# Altium project Custom_Keyboard.PrjPcb (part 4 of 4)

## Sheet BufferIC_Section.SchDoc
size A4
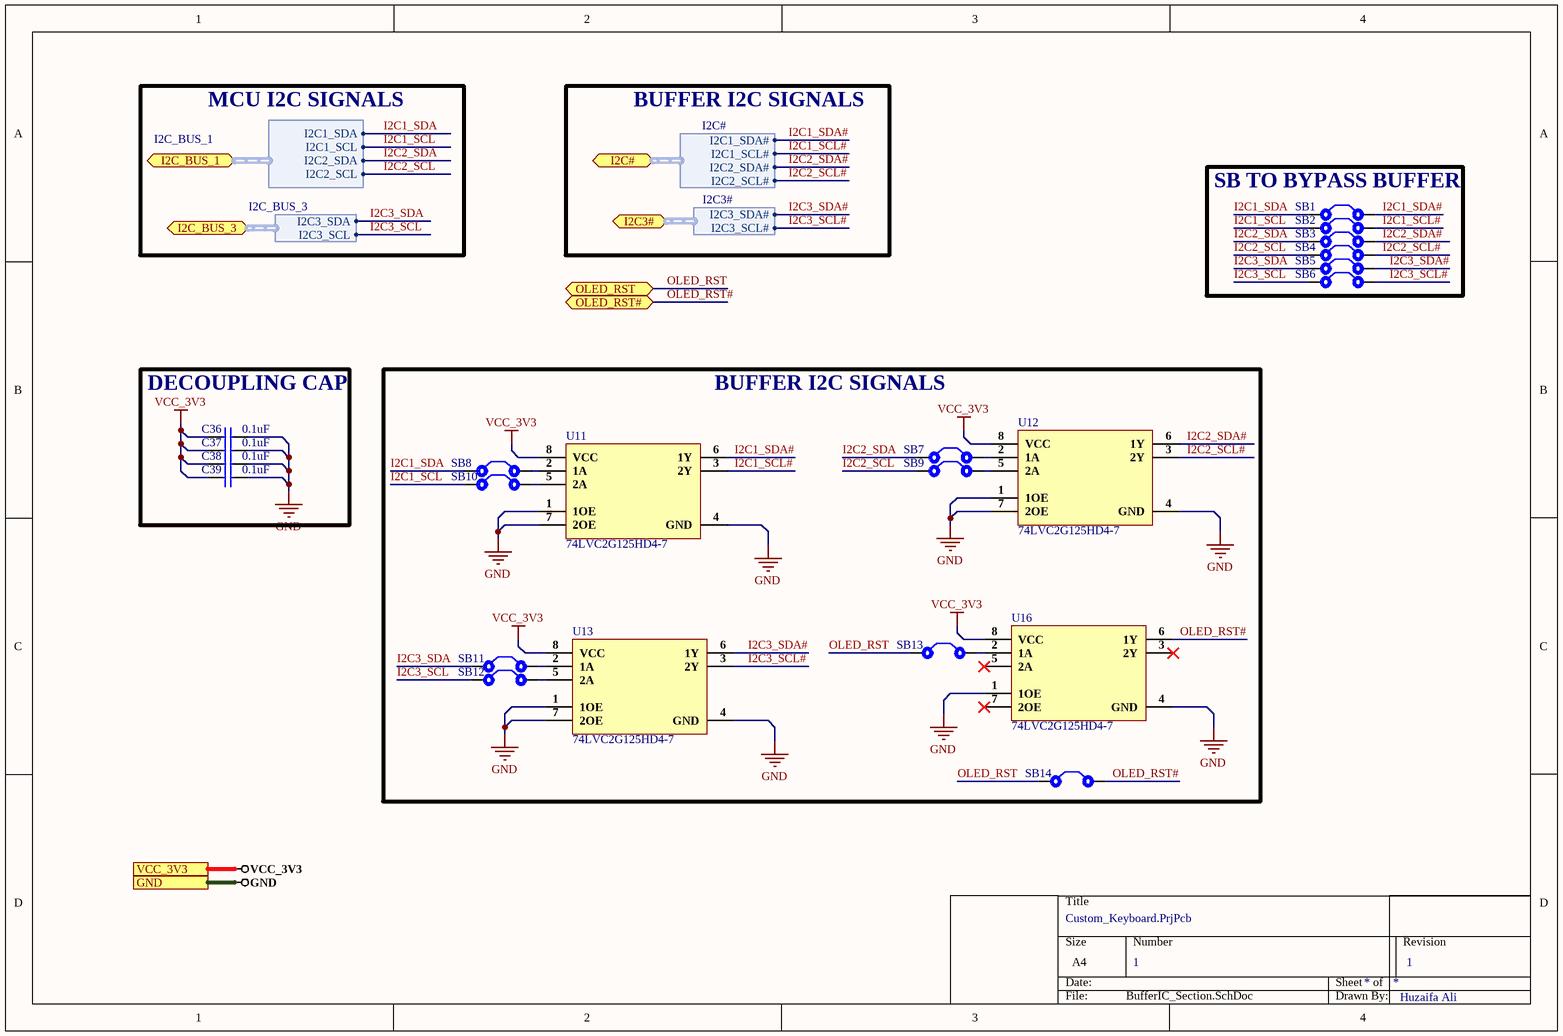
[diagram p14: BufferIC_Section.SchDoc]

### Parts
C36  0.1uF  [Cap0603]
C37  0.1uF  [Cap0603]
C38  0.1uF  [Cap0603]
C39  0.1uF  [Cap0603]
SB1  Solder Bridge  [Solder Bridge]  (value not drawn)
SB2  Solder Bridge  [Solder Bridge]  (value not drawn)
SB3  Solder Bridge  [Solder Bridge]  (value not drawn)
SB4  Solder Bridge  [Solder Bridge]  (value not drawn)
SB5  Solder Bridge  [Solder Bridge]  (value not drawn)
SB6  Solder Bridge  [Solder Bridge]  (value not drawn)
SB7  Solder Bridge  [Solder Bridge]  (value not drawn)
SB8  Solder Bridge  [Solder Bridge]  (value not drawn)
SB9  Solder Bridge  [Solder Bridge]  (value not drawn)
SB10  Solder Bridge  [Solder Bridge]  (value not drawn)
SB11  Solder Bridge  [Solder Bridge]  (value not drawn)
SB12  Solder Bridge  [Solder Bridge]  (value not drawn)
SB13  Solder Bridge  [Solder Bridge]  (value not drawn)
SB14  Solder Bridge  [Solder Bridge]  (value not drawn)
U11  74LVC2G125HD4-7  [74LVC2G125HD4-7]
U12  74LVC2G125HD4-7  [74LVC2G125HD4-7]
U13  74LVC2G125HD4-7  [74LVC2G125HD4-7]
U16  74LVC2G125HD4-7  [74LVC2G125HD4-7]

### Blocks framed on the sheet
SB TO BYPASS BUFFER: SB1-SB6
DECOUPLING CAP: C36-C39
BUFFER I2C SIGNALS: SB7-SB14 U11-U13 U16

### Ports
GND, I2C3# (bidir, harness I2C3#), I2C# (bidir, harness I2C#), I2C_BUS_1 (bidir, harness I2C_BUS_1), I2C_BUS_3 (bidir, harness I2C_BUS_3), OLED_RST (bidir), OLED_RST# (bidir), VCC_3V3

### Harnesses
I2C_BUS_1: I2C2_SDA, I2C1_SCL, I2C1_SDA, I2C2_SCL
I2C_BUS_3: I2C3_SDA, I2C3_SCL
I2C#: I2C1_SDA#, I2C1_SCL#, I2C2_SDA#, I2C2_SCL#
I2C3#: I2C3_SDA#, I2C3_SCL#

### Nets
GND: C36.2 C37.2 C38.2 C39.2 U11.1(1OE) U11.4(GND) U11.7(2OE) U12.1(1OE) U12.4(GND) U12.7(2OE) U13.1(1OE) U13.4(GND) U13.7(2OE) U16.1(1OE) U16.4(GND) ; port GND
VCC_3V3: C36.1 C37.1 C38.1 C39.1 U11.8(VCC) U12.8(VCC) U13.8(VCC) U16.8(VCC) ; port VCC_3V3
I2C1_SCL: SB2.1 SB10.1 ; port I2C_BUS_1.I2C1_SCL
I2C1_SCL#: SB2.2 U11.3(2Y) ; port I2C#.I2C1_SCL#  [project net I2C#.I2C1_SCL#]
I2C1_SDA: SB1.1 SB8.1 ; port I2C_BUS_1.I2C1_SDA
I2C1_SDA#: SB1.2 U11.6(1Y) ; port I2C#.I2C1_SDA#  [project net I2C#.I2C1_SDA#]
I2C2_SCL: SB4.1 SB9.1 ; port I2C_BUS_1.I2C2_SCL
I2C2_SCL#: SB4.2 U12.3(2Y) ; port I2C#.I2C2_SCL#  [project net I2C#.I2C2_SCL#]
I2C2_SDA: SB3.1 SB7.1 ; port I2C_BUS_1.I2C2_SDA
I2C2_SDA#: SB3.2 U12.6(1Y) ; port I2C#.I2C2_SDA#  [project net I2C#.I2C2_SDA#]
I2C3_SCL: SB6.1 SB12.1 ; port I2C_BUS_3.I2C3_SCL
I2C3_SCL#: SB6.2 U13.3(2Y) ; port I2C3#.I2C3_SCL#  [project net I2C3#.I2C3_SCL#]
I2C3_SDA: SB5.1 SB11.1 ; port I2C_BUS_3.I2C3_SDA
I2C3_SDA#: SB5.2 U13.6(1Y) ; port I2C3#.I2C3_SDA#  [project net I2C3#.I2C3_SDA#]
OLED_RST: SB13.1 SB14.1 ; port OLED_RST
OLED_RST#: SB14.2 U16.6(1Y) ; port OLED_RST#
NetSB7_2: SB7.2 U12.2(1A)
NetSB8_2: SB8.2 U11.2(1A)
NetSB9_2: SB9.2 U12.5(2A)
NetSB10_2: SB10.2 U11.5(2A)
NetSB11_2: SB11.2 U13.2(1A)
NetSB12_2: SB12.2 U13.5(2A)
NetSB13_2: SB13.2 U16.2(1A)

Not connected (* = marked no-connect by the designer): U16 3(2Y)* 5(2A)* 7(2OE)*

### Notes on the sheet
- MCU I2C SIGNALS
- BUFFER I2C SIGNALS
- 1
- Huzaifa Ali

### Library data of the parts
C36-C39 = CC0603ZRY5V9BB104: CAP CER 0.1UF 50V Y5V 0603; Manufacturer: Yageo; Capacitance: 100nF; Tolerance: 80%; Supplier 1: Digi-Key; Manufacturer Part Number: CC0603ZRY5V9BB104; Stock 1: 15000880; Pricing 1: 1=0.1, 10=0.075, 100=0.0334, 500=0.02386, 1000=0.01874 (USD); Mount: Surface Mount; Case/Package: 0603; Number of Pins: 2; Case Code (Metric): 1608; Case Code (Imperial): 0603; Min Operating Temperature: -30°C; Max Operating Temperature: 85°C; Dielectric: Y5V; Voltage Rating: 50V; Package Quantity: 1; Packaging: Tape and Reel; Voltage Rating (DC): 50V; Termination: SMD/SMT; Composition: Ceramic; Voltage: 50V; Length: 1.6mm; Height: 0.8mm; Width: 0.031inch; Thickness: 0.035inch; Depth: 0.8mm; Radiation Hardening: No; REACH SVHC: No SVHC; Lead Free: Lead Free; Halogen Free: Halogen Free; ComponentLink1URL: http://www.yageo.com/documents/recent/UPY-GPHC_Y5V_6.3V-to-50V_8.pdf?src-supplier=Digi-Key; ComponentLink1Description: http://www.yageo.com/documents/recent/UPY-GPHC_Y5V_6.3V-to-50V_8.pdf?src-supplier=Digi-Key; ComponentLink2URL: http://www.yageo.com/documents/recent/UPY-GPHC_Y5V_6.3V-to-50V_5.pdf?src-supplier=Avnet+Europe; ComponentLink2Description: http://www.yageo.com/documents/recent/UPY-GPHC_Y5V_6.3V-to-50V_5.pdf?src-supplier=Avnet+Europe; ComponentLink3URL: https://www.verical.com/server-webapp/html/getDatasheet?partID=403611&src-supplier=Verical; ComponentLink3Description: https://www.verical.com/server-webapp/html/getDatasheet?partID=403611&src-supplier=Verical; ComponentLink4URL: http://www.mouser.com/ds/2/447/Yageo_UPY-GP_NP0_16V-to-50V_9-358835.pdf?src-supplier=Mouser; ComponentLink4Description: http://www.mouser.com/ds/2/447/Yageo_UPY-GP_NP0_16V-to-50V_9-358835.pdf?src-supplier=Mouser; ComponentLink5URL: http://www.farnell.com/datasheets/1132289.pdf?src-supplier=Element14; ComponentLink5Description: http://www.farnell.com/datasheets/1132289.pdf?src-supplier=Element14; Supplier Part Number 1: 311-1343-1-ND
SB1-SB14 = Solder Bridge: Solder Bridge ON
U11-U13 U16 = 74LVC2G125HD4-7: IC BUFFER NON-INVERT 5.5V 8DFN; Manufacturer: Diodes; Logic Function: Buffer,Inverting; Number of Elements: 2; Number of Bits per Element: 1; High Level Output Current: 32mA; Supplier 1: Digi-Key; Manufacturer Part Number: 74LVC2G125HD4-7; RoHS: Yes; Category: Logic Gates; Pricing 1: 1=0.47000, 10=0.35300, 25=0.30880, 100=0.19980, 250=0.16536, 500=0.13228, 1000=0.10142, 2500=0.08819 (USD); Mount: Surface Mount; Number of Pins: 8; Min Operating Temperature: -40°C; Max Operating Temperature: 125°C; Packaging: Tape and Reel; Low Level Output Current: 32mA; RoHS Compliant: Yes; ComponentLink1URL: https://www.diodes.com/assets/Datasheets/74LVC2G125.pdf?src-supplier=Digi-Key; ComponentLink1Description: https://www.diodes.com/assets/Datasheets/74LVC2G125.pdf?src-supplier=Digi-Key; Supplier Part Number 1: 74LVC2G125HD4-7DIDKR-ND

## Nets that join several sheets
GND: Controller_Section_1 (29 pins), Power_Section (14 pins), Connector_Sheet (6 pins), Connector_Sheet_2 (J3.MP1 J3.MP2), Mux_Sheet_1 (14 pins), Mux_Sheet_2 (11 pins), Mux_Sheet _3 (7 pins), BufferIC_Section (15 pins)
VCC_3V3: Controller_Section_1 (22 pins), Controller_Section_2 (16 pins), Power_Section (C32.1 C33.1 U1.1), Connector_Sheet (J2.25), Mux_Sheet_1 (22 pins), Mux_Sheet_2 (15 pins), RPull_Section (80 pins), Rpull_Section2 (64 pins), Mux_Sheet _3 (9 pins), BufferIC_Section (8 pins)
VCC_5V: Power_Section (10 pins), Connector_Sheet (P1.1)
VDD: Power_Section (Q1.3), Connector_Sheet (J2.24)
COl_1: Controller_Section_2 (R6.1 U2.81), Connector_Sheet (J2.1)
COl_2: Controller_Section_2 (R37.1 U2.82), Connector_Sheet (J2.2)
COl_3: Controller_Section_2 (R38.1 U2.83), Connector_Sheet (J2.3)
COl_4: Controller_Section_2 (R39.1 U2.84), Connector_Sheet (J2.4)
COl_5: Controller_Section_2 (R40.1 U2.85), Connector_Sheet (J2.5)
COl_6: Controller_Section_2 (R41.1 U2.25), Connector_Sheet (J2.6)
COl_7: Controller_Section_2 (R42.1 U2.87), Connector_Sheet (J2.7)
COl_8: Controller_Section_2 (R110.1 U2.24), Connector_Sheet (J2.8)
COl_9: Controller_Section_2 (R111.1 U2.16), Connector_Sheet (J2.9)
COl_10: Controller_Section_2 (R112.1 U2.17), Connector_Sheet (J2.10)
COl_11: Controller_Section_2 (R113.1 U2.18), Connector_Sheet (J2.11)
COl_12: Controller_Section_2 (R114.1 U2.33), Connector_Sheet (J2.12)
COl_13: Controller_Section_2 (R115.1 U2.34), Connector_Sheet (J2.13)
COl_14: Controller_Section_2 (R116.1 U2.63), Connector_Sheet (J2.14)
COl_15: Controller_Section_2 (R117.1 U2.64), Connector_Sheet (J2.15)
COl_16: Controller_Section_2 (R118.1 U2.65), Connector_Sheet (J2.16)
DM: Controller_Section_2 (U2.70), Connector_Sheet (P2.1)
DP: Controller_Section_2 (U2.71), Connector_Sheet (P3.1)
I2C1_SCL: Controller_Section_2 (U2.92), BufferIC_Section (SB2.1 SB10.1)
I2C1_SDA: Controller_Section_2 (U2.93), BufferIC_Section (SB1.1 SB8.1)
I2C2_SCL: Controller_Section_2 (U2.47), BufferIC_Section (SB4.1 SB9.1)
I2C2_SDA: Controller_Section_2 (U2.48), BufferIC_Section (SB3.1 SB7.1)
I2C3#.I2C3_SCL#: Mux_Sheet_2 (R27.2 U6.22 U7.22 U10.22), BufferIC_Section (SB6.2 U13.3)
I2C3#.I2C3_SDA#: Mux_Sheet_2 (R25.2 U6.23 U7.23 U10.23), BufferIC_Section (SB5.2 U13.6)
I2C3_SCL: Controller_Section_2 (U2.67), BufferIC_Section (SB6.1 SB12.1)
I2C3_SDA: Controller_Section_2 (U2.66), BufferIC_Section (SB5.1 SB11.1)
I2C#.I2C1_SCL#: Mux_Sheet_1 (R11.2 U3.22 U4.22), Mux_Sheet _3 (U15.22), BufferIC_Section (SB2.2 U11.3)
I2C#.I2C1_SDA#: Mux_Sheet_1 (R9.2 U3.23 U4.23), Mux_Sheet _3 (U15.23), BufferIC_Section (SB1.2 U11.6)
I2C#.I2C2_SCL#: Mux_Sheet_1 (R20.2 U5.22 U9.22), Mux_Sheet _3 (U14.22), BufferIC_Section (SB4.2 U12.3)
I2C#.I2C2_SDA#: Mux_Sheet_1 (R19.2 U5.23 U9.23), Mux_Sheet _3 (U14.23), BufferIC_Section (SB3.2 U12.6)
MRST##.MRST8: Controller_Section_2 (U2.78), Mux_Sheet _3 (R142.2 U15.3)
MRST##.MRST9: Controller_Section_2 (U2.79), Mux_Sheet _3 (R140.2 U14.3)
MRST#.MRST4: Controller_Section_2 (U2.59), Mux_Sheet_2 (R32.2 U6.3)
MRST#.MRST5: Controller_Section_2 (U2.60), Mux_Sheet_2 (R34.2 U7.3)
MRST#.MRST7: Controller_Section_2 (U2.61), Mux_Sheet_2 (R135.2 U10.3)
MRST.MRST1: Controller_Section_2 (U2.55), Mux_Sheet_1 (R17.2 U4.3)
MRST.MRST2: Controller_Section_2 (U2.56), Mux_Sheet_1 (R13.2 U3.3)
MRST.MRST3: Controller_Section_2 (U2.57), Mux_Sheet_1 (R23.2 U5.3)
MRST.MRST6: Controller_Section_2 (U2.58), Mux_Sheet_1 (R26.2 U9.3)
MUX_1.SCL_1: Connector_Sheet (J1.9), Mux_Sheet_1 (U4.5), RPull_Section (R44.1)
MUX_1.SCL_2: Connector_Sheet (J1.10), Mux_Sheet_1 (U4.7), RPull_Section (R46.1)
MUX_1.SCL_3: Connector_Sheet (J1.11), Mux_Sheet_1 (U4.9), RPull_Section (R48.1)
MUX_1.SCL_4: Connector_Sheet (J1.12), Mux_Sheet_1 (U4.11), RPull_Section (R50.1)
MUX_1.SCL_5: Connector_Sheet (J1.13), Mux_Sheet_1 (U4.14), RPull_Section (R52.1)
MUX_1.SCL_6: Connector_Sheet (J1.14), Mux_Sheet_1 (U4.16), RPull_Section (R54.1)
MUX_1.SCL_7: Connector_Sheet (J1.15), Mux_Sheet_1 (U4.18), RPull_Section (R56.1)
MUX_1.SCL_8: Connector_Sheet (J1.16), Mux_Sheet_1 (U4.20), RPull_Section (R58.1)
MUX_1.SDA_1: Connector_Sheet (J1.1), Mux_Sheet_1 (U4.4), RPull_Section (R43.1)
MUX_1.SDA_2: Connector_Sheet (J1.2), Mux_Sheet_1 (U4.6), RPull_Section (R45.1)
MUX_1.SDA_3: Connector_Sheet (J1.3), Mux_Sheet_1 (U4.8), RPull_Section (R47.1)
MUX_1.SDA_4: Connector_Sheet (J1.4), Mux_Sheet_1 (U4.10), RPull_Section (R49.1)
MUX_1.SDA_5: Connector_Sheet (J1.5), Mux_Sheet_1 (U4.13), RPull_Section (R51.1)
MUX_1.SDA_6: Connector_Sheet (J1.6), Mux_Sheet_1 (U4.15), RPull_Section (R53.1)
MUX_1.SDA_7: Connector_Sheet (J1.7), Mux_Sheet_1 (U4.17), RPull_Section (R55.1)
MUX_1.SDA_8: Connector_Sheet (J1.8), Mux_Sheet_1 (U4.19), RPull_Section (R57.1)
MUX_2.SCL_9: Connector_Sheet (J1.25), Mux_Sheet_1 (U3.5), RPull_Section (R60.1)
MUX_2.SCL_10: Connector_Sheet (J1.26), Mux_Sheet_1 (U3.7), RPull_Section (R62.1)
MUX_2.SCL_11: Connector_Sheet (J1.27), Mux_Sheet_1 (U3.9), RPull_Section (R64.1)
MUX_2.SCL_12: Connector_Sheet (J1.28), Mux_Sheet_1 (U3.11), RPull_Section (R66.1)
MUX_2.SCL_13: Connector_Sheet (J1.29), Mux_Sheet_1 (U3.14), RPull_Section (R68.1)
MUX_2.SCL_14: Connector_Sheet (J1.30), Mux_Sheet_1 (U3.16), RPull_Section (R70.1)
MUX_2.SCL_15: Connector_Sheet (J1.31), Mux_Sheet_1 (U3.18), RPull_Section (R72.1)
MUX_2.SCL_16: Connector_Sheet (J1.32), Mux_Sheet_1 (U3.20), RPull_Section (R74.1)
MUX_2.SDA_9: Connector_Sheet (J1.17), Mux_Sheet_1 (U3.4), RPull_Section (R59.1)
MUX_2.SDA_10: Connector_Sheet (J1.18), Mux_Sheet_1 (U3.6), RPull_Section (R61.1)
MUX_2.SDA_11: Connector_Sheet (J1.19), Mux_Sheet_1 (U3.8), RPull_Section (R63.1)
MUX_2.SDA_12: Connector_Sheet (J1.20), Mux_Sheet_1 (U3.10), RPull_Section (R65.1)
MUX_2.SDA_13: Connector_Sheet (J1.21), Mux_Sheet_1 (U3.13), RPull_Section (R67.1)
MUX_2.SDA_14: Connector_Sheet (J1.22), Mux_Sheet_1 (U3.15), RPull_Section (R69.1)
MUX_2.SDA_15: Connector_Sheet (J1.23), Mux_Sheet_1 (U3.17), RPull_Section (R71.1)
MUX_2.SDA_16: Connector_Sheet (J1.24), Mux_Sheet_1 (U3.19), RPull_Section (R73.1)
MUX_3.SCL_17: Connector_Sheet (J1.41), Mux_Sheet_1 (U5.5), RPull_Section (R76.1)
MUX_3.SCL_18: Connector_Sheet (J1.42), Mux_Sheet_1 (U5.7), RPull_Section (R78.1)
MUX_3.SCL_19: Connector_Sheet (J1.43), Mux_Sheet_1 (U5.9), RPull_Section (R80.1)
MUX_3.SCL_20: Connector_Sheet (J1.44), Mux_Sheet_1 (U5.11), RPull_Section (R82.1)
MUX_3.SCL_21: Connector_Sheet (J1.45), Mux_Sheet_1 (U5.14), RPull_Section (R84.1)
MUX_3.SCL_22: Connector_Sheet (J1.46), Mux_Sheet_1 (U5.16), RPull_Section (R86.1)
MUX_3.SCL_23: Connector_Sheet (J1.47), Mux_Sheet_1 (U5.18), RPull_Section (R88.1)
MUX_3.SCL_24: Connector_Sheet (J1.48), Mux_Sheet_1 (U5.20), RPull_Section (R90.1)
MUX_3.SDA_17: Connector_Sheet (J1.33), Mux_Sheet_1 (U5.4), RPull_Section (R75.1)
MUX_3.SDA_18: Connector_Sheet (J1.34), Mux_Sheet_1 (U5.6), RPull_Section (R77.1)
MUX_3.SDA_19: Connector_Sheet (J1.35), Mux_Sheet_1 (U5.8), RPull_Section (R79.1)
MUX_3.SDA_20: Connector_Sheet (J1.36), Mux_Sheet_1 (U5.10), RPull_Section (R81.1)
MUX_3.SDA_21: Connector_Sheet (J1.37), Mux_Sheet_1 (U5.13), RPull_Section (R83.1)
MUX_3.SDA_22: Connector_Sheet (J1.38), Mux_Sheet_1 (U5.15), RPull_Section (R85.1)
MUX_3.SDA_23: Connector_Sheet (J1.39), Mux_Sheet_1 (U5.17), RPull_Section (R87.1)
MUX_3.SDA_24: Connector_Sheet (J1.40), Mux_Sheet_1 (U5.19), RPull_Section (R89.1)
MUX_4.SCL_25: Connector_Sheet (J1.57), Mux_Sheet_2 (U6.5), RPull_Section (R92.1)
MUX_4.SCL_26: Connector_Sheet (J1.58), Mux_Sheet_2 (U6.7), RPull_Section (R94.1)
MUX_4.SCL_27: Connector_Sheet (J1.59), Mux_Sheet_2 (U6.9), RPull_Section (R96.1)
MUX_4.SCL_28: Connector_Sheet (J1.60), Mux_Sheet_2 (U6.11), RPull_Section (R98.1)
MUX_4.SCL_29: Connector_Sheet (J1.61), Mux_Sheet_2 (U6.14), RPull_Section (R100.1)
MUX_4.SCL_30: Connector_Sheet (J1.62), Mux_Sheet_2 (U6.16), RPull_Section (R102.1)
MUX_4.SCL_31: Connector_Sheet (J1.63), Mux_Sheet_2 (U6.18), RPull_Section (R104.1)
MUX_4.SCL_32: Connector_Sheet (J1.64), Mux_Sheet_2 (U6.20), RPull_Section (R106.1)
MUX_4.SDA_25: Connector_Sheet (J1.49), Mux_Sheet_2 (U6.4), RPull_Section (R91.1)
MUX_4.SDA_26: Connector_Sheet (J1.50), Mux_Sheet_2 (U6.6), RPull_Section (R93.1)
MUX_4.SDA_27: Connector_Sheet (J1.51), Mux_Sheet_2 (U6.8), RPull_Section (R95.1)
MUX_4.SDA_28: Connector_Sheet (J1.52), Mux_Sheet_2 (U6.10), RPull_Section (R97.1)
MUX_4.SDA_29: Connector_Sheet (J1.53), Mux_Sheet_2 (U6.13), RPull_Section (R99.1)
MUX_4.SDA_30: Connector_Sheet (J1.54), Mux_Sheet_2 (U6.15), RPull_Section (R101.1)
MUX_4.SDA_31: Connector_Sheet (J1.55), Mux_Sheet_2 (U6.17), RPull_Section (R103.1)
MUX_4.SDA_32: Connector_Sheet (J1.56), Mux_Sheet_2 (U6.19), RPull_Section (R105.1)
MUX_5.SCL_33: Connector_Sheet (J1.73), Mux_Sheet_2 (U7.5), RPull_Section (R108.1)
MUX_5.SCL_34: Connector_Sheet (J1.74), Mux_Sheet_2 (U7.7), RPull_Section (R120.1)
MUX_5.SCL_35: Connector_Sheet (J1.75), Mux_Sheet_2 (U7.9), RPull_Section (R122.1)
MUX_5.SCL_36: Connector_Sheet (J1.76), Mux_Sheet_2 (U7.11), RPull_Section (R124.1)
MUX_5.SCL_37: Connector_Sheet (J1.77), Mux_Sheet_2 (U7.14), RPull_Section (R126.1)
MUX_5.SCL_38: Connector_Sheet (J1.78), Mux_Sheet_2 (U7.16), RPull_Section (R128.1)
MUX_5.SCL_39: Connector_Sheet (J1.79), Mux_Sheet_2 (U7.18), RPull_Section (R130.1)
MUX_5.SCL_40: Connector_Sheet (J1.80), Mux_Sheet_2 (U7.20), RPull_Section (R132.1)
MUX_5.SDA_33: Connector_Sheet (J1.65), Mux_Sheet_2 (U7.4), RPull_Section (R107.1)
MUX_5.SDA_34: Connector_Sheet (J1.66), Mux_Sheet_2 (U7.6), RPull_Section (R109.1)
MUX_5.SDA_35: Connector_Sheet (J1.67), Mux_Sheet_2 (U7.8), RPull_Section (R121.1)
MUX_5.SDA_36: Connector_Sheet (J1.68), Mux_Sheet_2 (U7.10), RPull_Section (R123.1)
MUX_5.SDA_37: Connector_Sheet (J1.69), Mux_Sheet_2 (U7.13), RPull_Section (R125.1)
MUX_5.SDA_38: Connector_Sheet (J1.70), Mux_Sheet_2 (U7.15), RPull_Section (R127.1)
MUX_5.SDA_39: Connector_Sheet (J1.71), Mux_Sheet_2 (U7.17), RPull_Section (R129.1)
MUX_5.SDA_40: Connector_Sheet (J1.72), Mux_Sheet_2 (U7.19), RPull_Section (R131.1)
MUX_6.SCL_41: Connector_Sheet_2 (J3.9), Mux_Sheet_1 (U9.5), Rpull_Section2 (R149.1)
MUX_6.SCL_42: Connector_Sheet_2 (J3.10), Mux_Sheet_1 (U9.7), Rpull_Section2 (R157.1)
MUX_6.SCL_43: Connector_Sheet_2 (J3.11), Mux_Sheet_1 (U9.9), Rpull_Section2 (R165.1)
MUX_6.SCL_44: Connector_Sheet_2 (J3.12), Mux_Sheet_1 (U9.11), Rpull_Section2 (R173.1)
MUX_6.SCL_45: Connector_Sheet_2 (J3.13), Mux_Sheet_1 (U9.14), Rpull_Section2 (R181.1)
MUX_6.SCL_46: Connector_Sheet_2 (J3.14), Mux_Sheet_1 (U9.16), Rpull_Section2 (R189.1)
MUX_6.SCL_47: Connector_Sheet_2 (J3.15), Mux_Sheet_1 (U9.18), Rpull_Section2 (R197.1)
MUX_6.SCL_48: Connector_Sheet_2 (J3.16), Mux_Sheet_1 (U9.20), Rpull_Section2 (R205.1)
MUX_6.SDA_41: Connector_Sheet_2 (J3.1), Mux_Sheet_1 (U9.4), Rpull_Section2 (R145.1)
MUX_6.SDA_42: Connector_Sheet_2 (J3.2), Mux_Sheet_1 (U9.6), Rpull_Section2 (R153.1)
MUX_6.SDA_43: Connector_Sheet_2 (J3.3), Mux_Sheet_1 (U9.8), Rpull_Section2 (R161.1)
MUX_6.SDA_44: Connector_Sheet_2 (J3.4), Mux_Sheet_1 (U9.10), Rpull_Section2 (R169.1)
MUX_6.SDA_45: Connector_Sheet_2 (J3.5), Mux_Sheet_1 (U9.13), Rpull_Section2 (R177.1)
MUX_6.SDA_46: Connector_Sheet_2 (J3.6), Mux_Sheet_1 (U9.15), Rpull_Section2 (R185.1)
MUX_6.SDA_47: Connector_Sheet_2 (J3.7), Mux_Sheet_1 (U9.17), Rpull_Section2 (R193.1)
MUX_6.SDA_48: Connector_Sheet_2 (J3.8), Mux_Sheet_1 (U9.19), Rpull_Section2 (R201.1)
MUX_7.SCL_49: Connector_Sheet_2 (J3.25), Mux_Sheet_2 (U10.5), Rpull_Section2 (R150.1)
MUX_7.SCL_50: Connector_Sheet_2 (J3.26), Mux_Sheet_2 (U10.7), Rpull_Section2 (R158.1)
MUX_7.SCL_51: Connector_Sheet_2 (J3.27), Mux_Sheet_2 (U10.9), Rpull_Section2 (R166.1)
MUX_7.SCL_52: Connector_Sheet_2 (J3.28), Mux_Sheet_2 (U10.11), Rpull_Section2 (R174.1)
MUX_7.SCL_53: Connector_Sheet_2 (J3.29), Mux_Sheet_2 (U10.14), Rpull_Section2 (R182.1)
MUX_7.SCL_54: Connector_Sheet_2 (J3.30), Mux_Sheet_2 (U10.16), Rpull_Section2 (R190.1)
MUX_7.SCL_55: Connector_Sheet_2 (J3.31), Mux_Sheet_2 (U10.18), Rpull_Section2 (R198.1)
MUX_7.SCL_56: Connector_Sheet_2 (J3.32), Mux_Sheet_2 (U10.20), Rpull_Section2 (R206.1)
MUX_7.SDA_49: Connector_Sheet_2 (J3.17), Mux_Sheet_2 (U10.4), Rpull_Section2 (R146.1)
MUX_7.SDA_50: Connector_Sheet_2 (J3.18), Mux_Sheet_2 (U10.6), Rpull_Section2 (R154.1)
MUX_7.SDA_51: Connector_Sheet_2 (J3.19), Mux_Sheet_2 (U10.8), Rpull_Section2 (R162.1)
MUX_7.SDA_52: Connector_Sheet_2 (J3.20), Mux_Sheet_2 (U10.10), Rpull_Section2 (R170.1)
MUX_7.SDA_53: Connector_Sheet_2 (J3.21), Mux_Sheet_2 (U10.13), Rpull_Section2 (R178.1)
MUX_7.SDA_54: Connector_Sheet_2 (J3.22), Mux_Sheet_2 (U10.15), Rpull_Section2 (R186.1)
MUX_7.SDA_55: Connector_Sheet_2 (J3.23), Mux_Sheet_2 (U10.17), Rpull_Section2 (R194.1)
MUX_7.SDA_56: Connector_Sheet_2 (J3.24), Mux_Sheet_2 (U10.19), Rpull_Section2 (R202.1)
MUX_8.SCL_57: Connector_Sheet_2 (J3.41), Rpull_Section2 (R151.1), Mux_Sheet _3 (U15.5)
MUX_8.SCL_58: Connector_Sheet_2 (J3.42), Rpull_Section2 (R159.1), Mux_Sheet _3 (U15.7)
MUX_8.SCL_59: Connector_Sheet_2 (J3.43), Rpull_Section2 (R167.1), Mux_Sheet _3 (U15.9)
MUX_8.SCL_60: Connector_Sheet_2 (J3.44), Rpull_Section2 (R175.1), Mux_Sheet _3 (U15.11)
MUX_8.SCL_61: Connector_Sheet_2 (J3.45), Rpull_Section2 (R183.1), Mux_Sheet _3 (U15.14)
MUX_8.SCL_62: Connector_Sheet_2 (J3.46), Rpull_Section2 (R191.1), Mux_Sheet _3 (U15.16)
MUX_8.SCL_63: Connector_Sheet_2 (J3.47), Rpull_Section2 (R199.1), Mux_Sheet _3 (U15.18)
MUX_8.SCL_64: Connector_Sheet_2 (J3.48), Rpull_Section2 (R207.1), Mux_Sheet _3 (U15.20)
MUX_8.SDA_57: Connector_Sheet_2 (J3.33), Rpull_Section2 (R147.1), Mux_Sheet _3 (U15.4)
MUX_8.SDA_58: Connector_Sheet_2 (J3.34), Rpull_Section2 (R155.1), Mux_Sheet _3 (U15.6)
MUX_8.SDA_59: Connector_Sheet_2 (J3.35), Rpull_Section2 (R163.1), Mux_Sheet _3 (U15.8)
MUX_8.SDA_60: Connector_Sheet_2 (J3.36), Rpull_Section2 (R171.1), Mux_Sheet _3 (U15.10)
MUX_8.SDA_61: Connector_Sheet_2 (J3.37), Rpull_Section2 (R179.1), Mux_Sheet _3 (U15.13)
MUX_8.SDA_62: Connector_Sheet_2 (J3.38), Rpull_Section2 (R187.1), Mux_Sheet _3 (U15.15)
MUX_8.SDA_63: Connector_Sheet_2 (J3.39), Rpull_Section2 (R195.1), Mux_Sheet _3 (U15.17)
MUX_8.SDA_64: Connector_Sheet_2 (J3.40), Rpull_Section2 (R203.1), Mux_Sheet _3 (U15.19)
MUX_9.SCL_65: Connector_Sheet_2 (J3.57), Rpull_Section2 (R152.1), Mux_Sheet _3 (U14.5)
MUX_9.SCL_66: Connector_Sheet_2 (J3.58), Rpull_Section2 (R160.1), Mux_Sheet _3 (U14.7)
MUX_9.SCL_67: Connector_Sheet_2 (J3.59), Rpull_Section2 (R168.1), Mux_Sheet _3 (U14.9)
MUX_9.SCL_68: Connector_Sheet_2 (J3.60), Rpull_Section2 (R176.1), Mux_Sheet _3 (U14.11)
MUX_9.SCL_69: Connector_Sheet_2 (J3.61), Rpull_Section2 (R184.1), Mux_Sheet _3 (U14.14)
MUX_9.SCL_70: Connector_Sheet_2 (J3.62), Rpull_Section2 (R192.1), Mux_Sheet _3 (U14.16)
MUX_9.SCL_71: Connector_Sheet_2 (J3.63), Rpull_Section2 (R200.1), Mux_Sheet _3 (U14.18)
MUX_9.SCL_72: Connector_Sheet_2 (J3.64), Rpull_Section2 (R208.1), Mux_Sheet _3 (U14.20)
MUX_9.SDA_65: Connector_Sheet_2 (J3.49), Rpull_Section2 (R148.1), Mux_Sheet _3 (U14.4)
MUX_9.SDA_66: Connector_Sheet_2 (J3.50), Rpull_Section2 (R156.1), Mux_Sheet _3 (U14.6)
MUX_9.SDA_67: Connector_Sheet_2 (J3.51), Rpull_Section2 (R164.1), Mux_Sheet _3 (U14.8)
MUX_9.SDA_68: Connector_Sheet_2 (J3.52), Rpull_Section2 (R172.1), Mux_Sheet _3 (U14.10)
MUX_9.SDA_69: Connector_Sheet_2 (J3.53), Rpull_Section2 (R180.1), Mux_Sheet _3 (U14.13)
MUX_9.SDA_70: Connector_Sheet_2 (J3.54), Rpull_Section2 (R188.1), Mux_Sheet _3 (U14.15)
MUX_9.SDA_71: Connector_Sheet_2 (J3.55), Rpull_Section2 (R196.1), Mux_Sheet _3 (U14.17)
MUX_9.SDA_72: Connector_Sheet_2 (J3.56), Rpull_Section2 (R204.1), Mux_Sheet _3 (U14.19)
OLED_IO: Controller_Section_2 (U2.88), Power_Section (Q2.1 R5.2)
OLED_RST: Controller_Section_2 (U2.86), BufferIC_Section (SB13.1 SB14.1)
OLED_RST#: Connector_Sheet_2 (J3.65), BufferIC_Section (SB14.2 U16.6)
ROW_1: Controller_Section_2 (U2.35), Connector_Sheet (J2.17)
ROW_2: Controller_Section_2 (U2.36), Connector_Sheet (J2.18)
ROW_3: Controller_Section_2 (U2.89), Connector_Sheet (J2.19)
ROW_4: Controller_Section_2 (U2.90), Connector_Sheet (J2.20)
ROW_5: Controller_Section_2 (U2.91), Connector_Sheet (J2.21)